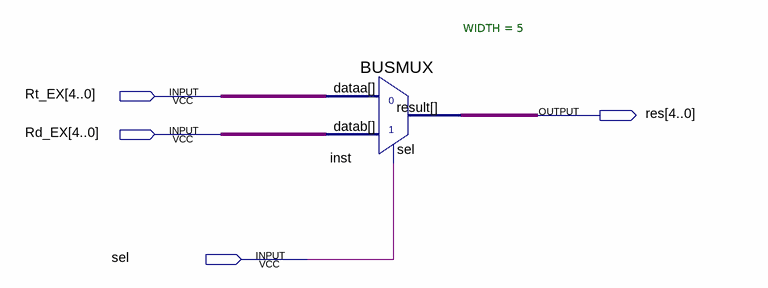
[diagram p0: schematic sheet]
// Quartus schematic MUX2x5.bdf as structural Verilog: 1 symbols, 4 pins
module MUX2x5 (
  input  [4:0] Rt_EX,
  input  [4:0] Rd_EX,
  input  sel,
  output [4:0] res
);

  BUSMUX #(.WIDTH(5)) inst (.datab(Rd_EX), .sel(sel), .dataa(Rt_EX), .result(res));
endmodule
